# Altium schematic sheet Current Sense.SchDoc
size A; SheetNumber: 2; SheetTotal: 2
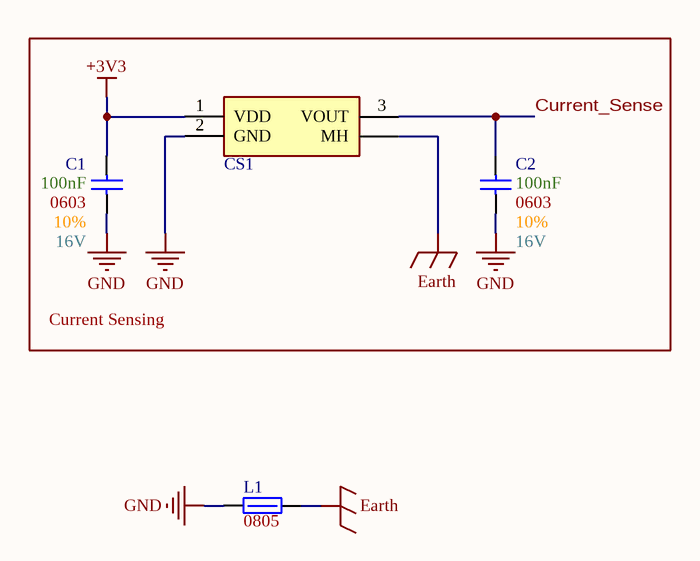
[diagram p0: Current Sense.SchDoc]

## Parts
C1  Max Voltage: 16V  Size Package: 0603  Tolerance: 10%  Capacitance: 100nF  [[Cap] SMD 0603]  (hidden comment: [Cap] 0603 0.1uF 10% 16V)
C2  Max Voltage: 16V  Size Package: 0603  Tolerance: 10%  Capacitance: 100nF  [[Cap] SMD 0603]  (hidden comment: [Cap] 0603 0.1uF 10% 16V)
CS1  [Current Sense] WCS1600  [[Current Sense] WCS1600]  (value not drawn)
L1  Size Package: 0805  [[Ferrite] SMD 0805]  (hidden comment: 652-MH2029-300Y)

## Blocks framed on the sheet
Current Sensing: C1 C2 CS1

## Nets
+3V3: C1.2 CS1.1(VDD)
Earth: CS1.X(MH) L1.2
GND: C1.1 C2.1 CS1.2(GND) L1.1
Current_Sense: C2.2 CS1.3(VOUT)

## Library data of the parts
C1 C2 = [Cap] 0603 0.1uF 10% 16V: CC0603KRX7R7BB104; Supplier 1: DigiKey; Supplier Part Number 1: 311-1088-6-ND
CS1 = [Current Sense] WCS1600: WCS1600; ComponentLink1Description: Datasheet; ComponentLink1URL: https://www.winson.com.tw/uploads/images/WCS1600.pdf
L1 = [Ferrite] SMD 0805 3A 30ohm: Res @ Freq: 30 @ 100MHz; Supplier 1: DigiKey; Supplier Part Number 1: MH2029-300YCT-ND